# Altium project pinger-uP-re.PrjPcb
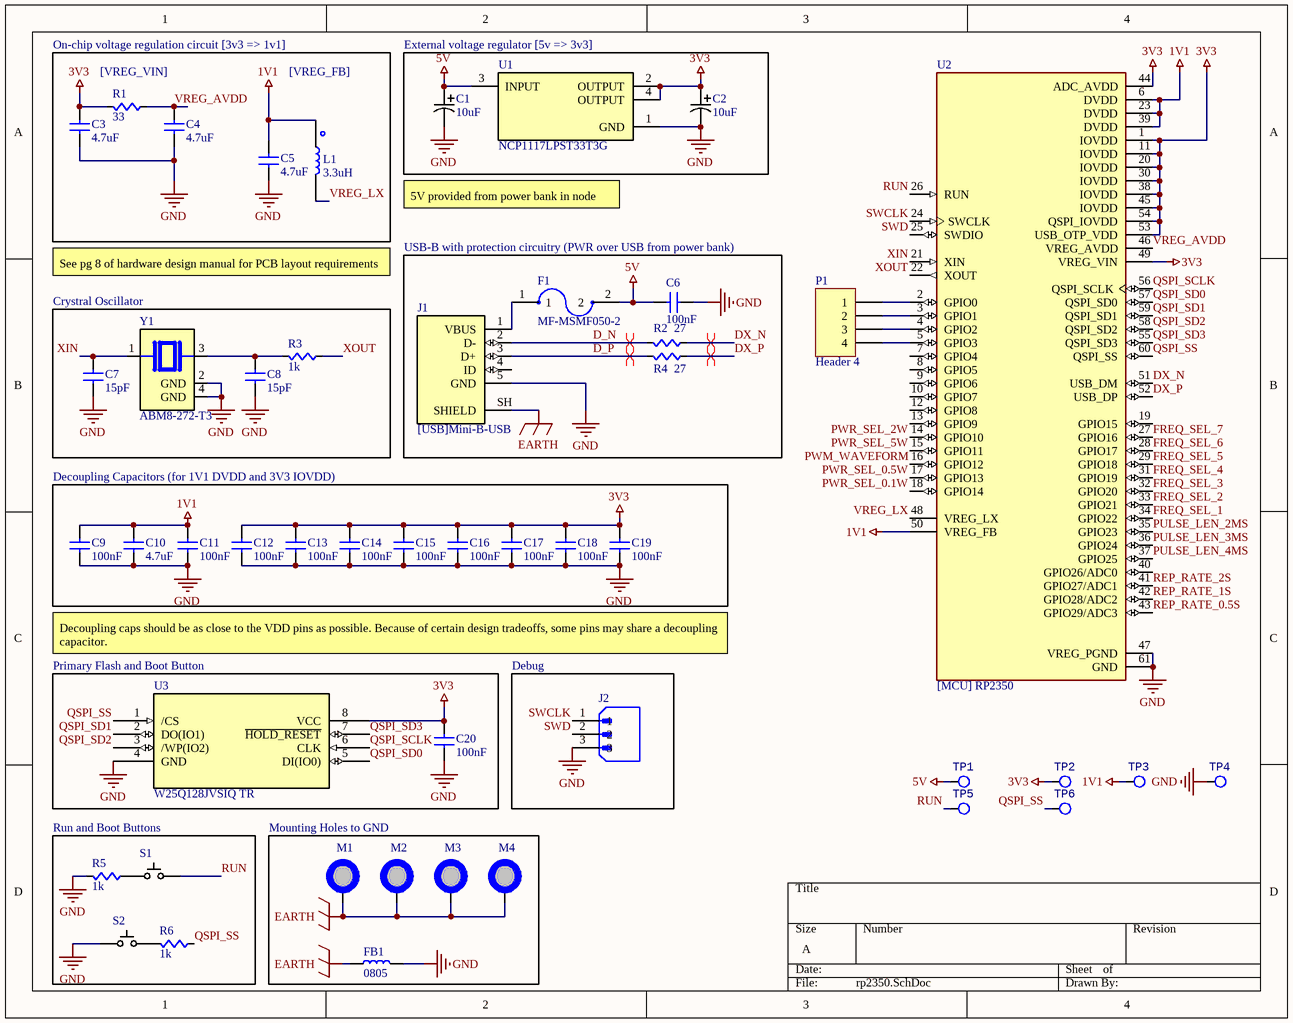
[diagram p0: rp2350.SchDoc]
2 sheets, 89 parts. Net scope: global (net labels, ports and power ports of the same name join across sheets).
Board files: joemain.PcbDoc, main.PcbDoc
Sheets:
  rp2350.SchDoc
  waveform-output.SchDoc

## Sheet rp2350.SchDoc
size A; SheetNumber: 1; SheetTotal: 2

### Parts
C1  10uF  [RADIAL_CAN_CAP_4_X_5.8_SMD]
C2  10uF  [RADIAL_CAN_CAP_4_X_5.8_SMD]
C3  value 4.7uF  [CAPC0603]  (hidden comment: Cap)
C4  value 4.7uF  [CAPC0603]  (hidden comment: Cap)
C5  value 4.7uF  [CAPC0603]  (hidden comment: Cap)
C6  value 100nF  [CAPC0603]  (hidden comment: Cap)
C7  value 15pF  [CAPC0603]  (hidden comment: Cap)
C8  value 15pF  [CAPC0603]  (hidden comment: Cap)
C9  value 100nF  [CAPC0603]  (hidden comment: Cap)
C10  value 4.7uF  [CAPC0603]  (hidden comment: Cap)
C11  value 100nF  [CAPC0603]  (hidden comment: Cap)
C12  value 100nF  [CAPC0603]  (hidden comment: Cap)
C13  value 100nF  [CAPC0603]  (hidden comment: Cap)
C14  value 100nF  [CAPC0603]  (hidden comment: Cap)
C15  value 100nF  [CAPC0603]  (hidden comment: Cap)
C16  value 100nF  [CAPC0603]  (hidden comment: Cap)
C17  value 100nF  [CAPC0603]  (hidden comment: Cap)
C18  value 100nF  [CAPC0603]  (hidden comment: Cap)
C19  value 100nF  [CAPC0603]  (hidden comment: Cap)
C20  value 100nF  [CAPC0603]  (hidden comment: Cap)
F1  MF-MSMF050-2  [FUSM4632X85]
FB1  0805  [L0805]
J1  [USB]Mini-B-USB  [SAMTEC_MUSB-05-X-B-SM-A-R-K-TR]
J2  [Connector] 1x3-header-2.54mm pitch  [1x3-2.54MM-MALE-HEADER]  (value not drawn)
L1  3.3uH  [2016_SMD_Inductor]
M1  M3 Mount Hole  [3.5MM-MOUNTING-HOLE]  (value not drawn)  (no BOM)
M2  M3 Mount Hole  [3.5MM-MOUNTING-HOLE]  (value not drawn)  (no BOM)
M3  M3 Mount Hole  [3.5MM-MOUNTING-HOLE]  (value not drawn)  (no BOM)
M4  M3 Mount Hole  [3.5MM-MOUNTING-HOLE]  (value not drawn)  (no BOM)
P1  Header 4  [HDR1X4]
R1  value 33  [RES0603]  (hidden comment: Res)
R2  value 27  [RES0603]  (hidden comment: Res)
R3  value 1k  [RES0603]  (hidden comment: Res)
R4  value 27  [RES0603]  (hidden comment: Res)
R5  value 1k  [RES0603]  (hidden comment: Res)
R6  value 1k  [RES0603]  (hidden comment: Res)
S1  [SPST] SMD Pushbutton  [[SPST] SMD Pushbutton]  (value not drawn)
S2  [SPST] SMD Pushbutton  [[SPST] SMD Pushbutton]  (value not drawn)
TP1  TP  [TPTH-100mil]  (value not drawn)  (no BOM)
TP2  TP  [TPTH-100mil]  (value not drawn)  (no BOM)
TP3  TP  [TPTH-100mil]  (value not drawn)  (no BOM)
TP4  TP  [TPTH-100mil]  (value not drawn)  (no BOM)
TP5  TP  [TPTH-100mil]  (value not drawn)  (no BOM)
TP6  TP  [TPTH-100mil]  (value not drawn)  (no BOM)
U1  NCP1117LPST33T3G  [SOT230P700X175-4N]
U2  [MCU] RP2350  [QFN40P700X700X90-61N]
U3  W25Q128JVSIQ TR  [SOIC-8-W-208MIL-2]
Y1  ABM8-272-T3  [XTAL_ABM8-272-T3]

### Blocks framed on the sheet
External voltage regulator [5v => 3v3]: C1 C2 U1
Crystral Oscillator: C7 C8 R3 Y1
Decoupling Capacitors (for 1V1 DVDD and 3V3 IOVDD): C9-C19
Primary Flash and Boot Button: C20 U3
Debug: J2
Run and Boot Buttons: R5 R6 S1 S2
Mounting Holes to GND: FB1 M1-M4

### Nets
1V1: C5.1(A) C9.1(A) C10.1(A) C11.1(A) L1.1 TP3.1 U2.6(DVDD) U2.23(DVDD) U2.39(DVDD) U2.50(VREG_FB)
3V3: C2.1 C3.1(A) C12.1(A) C13.1(A) C14.1(A) C15.1(A) C16.1(A) C17.1(A) C18.1(A) C19.1(A) C20.1(A) R1.1(A) TP2.1 U1.2(OUTPUT) U1.4(OUTPUT) U2.1(IOVDD) U2.11(IOVDD) U2.20(IOVDD) U2.30(IOVDD) U2.38(IOVDD) U2.44(ADC_AVDD) U2.45(IOVDD) U2.49(VREG_VIN) U2.53(USB_OTP_VDD) U2.54(QSPI_IOVDD) U3.8(VCC)
5V: C1.1 C6.2(B) F1.2 TP1.1 U1.3(INPUT)
EARTH: FB1.1 J1.SH(SHIELD) M1.1 M2.1 M3.1 M4.1
GND: C1.2 C2.2 C3.2(B) C4.2(B) C5.2(B) C6.1(A) C7.2(B) C8.2(B) C9.2(B) C10.2(B) C11.2(B) C12.2(B) C13.2(B) C14.2(B) C15.2(B) C16.2(B) C17.2(B) C18.2(B) C19.2(B) C20.2(B) FB1.2 J1.5(GND) J2.3 R5.1(A) S2.1 TP4.1 U1.1(GND) U2.47(VREG_PGND) U2.61(GND) U3.4(GND) Y1.2(GND) Y1.4(GND)
D_N: J1.2(D-) R2.1(A)
D_P: J1.3(D+) R4.1(A)
DX_N: R2.2(B) U2.51(USB_DM)
DX_P: R4.2(B) U2.52(USB_DP)
FREQ_SEL_1: U2.34(GPIO22)
FREQ_SEL_2: U2.33(GPIO21)
FREQ_SEL_3: U2.32(GPIO20)
FREQ_SEL_4: U2.31(GPIO19)
FREQ_SEL_5: U2.29(GPIO18)
FREQ_SEL_6: U2.28(GPIO17)
FREQ_SEL_7: U2.27(GPIO16)
PULSE_LEN_2MS: U2.35(GPIO23)
PULSE_LEN_3MS: U2.36(GPIO24)
PULSE_LEN_4MS: U2.37(GPIO25)
PWM_WAVEFORM: U2.16(GPIO12)
PWR_SEL_0.1W: U2.18(GPIO14)
PWR_SEL_0.5W: U2.17(GPIO13)
PWR_SEL_2W: U2.14(GPIO10)
PWR_SEL_5W: U2.15(GPIO11)
QSPI_SCLK: U2.56(QSPI_SCLK) U3.6(CLK)
QSPI_SD0: U2.57(QSPI_SD0) U3.5(DI(IO0))
QSPI_SD1: U2.59(QSPI_SD1) U3.2(DO(IO1))
QSPI_SD2: U2.58(QSPI_SD2) U3.3(/WP(IO2))
QSPI_SD3: U2.55(QSPI_SD3) U3.7(~{HOLD_RESET})
QSPI_SS: R6.2(B) TP6.1 U2.60(QSPI_SS) U3.1(/CS)
REP_RATE_0.5S: U2.43(GPIO29/ADC3)
REP_RATE_1S: U2.42(GPIO28/ADC2)
REP_RATE_2S: U2.41(GPIO27/ADC1)
RUN: S1.2 TP5.1 U2.26(RUN)
SWCLK: J2.1 U2.24(SWCLK)
SWD: J2.2 U2.25(SWDIO)
VREG_AVDD: C4.1(A) R1.2(B) U2.46(VREG_AVDD)
VREG_LX: L1.2 U2.48(VREG_LX)
XIN: C7.1(A) U2.21(XIN) Y1.1
XOUT: R3.2(B) U2.22(XOUT)
NetC8_1: C8.1(A) R3.1(A) Y1.3
NetF1_1: F1.1 J1.1(VBUS)
NetP1_1: P1.1 U2.2(GPIO0)
NetP1_2: P1.2 U2.3(GPIO1)
NetP1_3: P1.3 U2.4(GPIO2)
NetP1_4: P1.4 U2.5(GPIO3)
NetR5_2: R5.2(B) S1.1
NetR6_1: R6.1(A) S2.2

Not connected (* = marked no-connect by the designer): J1 4(ID); U2 7(GPIO4) 8(GPIO5) 9(GPIO6) 10(GPIO7) 12(GPIO8) 13(GPIO9) 19(GPIO15) 40(GPIO26/ADC0)

### Layout directives
differential pair: D_N, D_P, DX_N, DX_P

### Notes on the sheet
- On-chip voltage regulation circuit [3v3 => 1v1]
- [VREG_VIN]
- [VREG_FB]
- 5V provided from power bank in node
- See pg 8 of hardware design manual for PCB layout requirements
- USB-B with protection circuitry (PWR over USB from power bank)
- Decoupling caps should be as close to the VDD pins as possible. Because of certain design tradeoffs, some pins may share a decoupling capacitor.

### Library data of the parts
C1 C2 = EEE-FK1E100R: 10uF electrolytic cap, radial can, SMD; Manufacturer_Name: Panasonic; Copyright: Copyright (C) 2025 Ultra Librarian. All rights reserved.; Manufacturer_Part_Number: EEE-FK1E100R
F1 = MF-MSMF050-2: [Fuse] Polymeric PTC Resettable Fuse 15V 500 mA Ih Surface Mount 1812 (4532 Metric), Concave; MF: Bourns; MP: MF-MSMF050-2; Availability: In Stock; Check_prices: https://www.snapeda.com/parts/MF-MSMF050-2/Bourns+-+J.W.+Miller/view-part/?ref=eda; Price: None; Package: 1812 Bourns; Purchase-URL: https://pricing.snapeda.com/search/part/MF-MSMF050-2/?ref=eda; Value: *; SnapEDA_Link: https://www.snapeda.com/parts/MF-MSMF050-2/Bourns+-+J.W.+Miller/view-part/?ref=snap
FB1 = MH2029-300Y: [Inductor] Ferrite Bead Bourns MH2029-300Y / SMD-FERRITE-BEAD-30R-3A(0805); SnapEDA_Link: https://www.snapeda.com/parts/MH2029-300Y/Bourns/view-part/?ref=snap; Package: 0805 Bourns; Value: *; MF: Bourns; MP: MH2029-300Y; Check_prices: https://www.snapeda.com/parts/MH2029-300Y/Bourns/view-part/?ref=eda
J1 = [USB]Mini-B-USB: USB - mini B USB 2.0 Receptacle Connector 5 Position Surface Mount, Right Angle / MUSB-05-X-B-SM-A-R-K-TR; MF: Samtec; MP: MUSB-05-F-B-SM-A-R-K-TR; SnapEDA_Link: https://www.snapeda.com/parts/MUSB-05-F-B-SM-A-R-K-TR/Samtec/view-part/?ref=snap; Package: None; Value: *; Check_prices: https://www.snapeda.com/parts/MUSB-05-F-B-SM-A-R-K-TR/Samtec/view-part/?ref=eda
J2 = [Connector] 1x3-header-2.54mm pitch: 1x3 2.54mm header; MP: G800W305018EU; MF: FCI Connectors; Availability: In Stock; Value: *; SnapEDA_Link: https://www.snapeda.com/parts/G800W305018EU/NEC/view-part/?ref=snap; Price: None; Check_prices: https://www.snapeda.com/parts/G800W305018EU/NEC/view-part/?ref=eda; Package: None
L1 = INDUCTOR 3.3uH: Power Inductors - SMD IND 3.3uH used for RP2350 VREG; Manufacturer_Name: ABRACON; Manufacturer_Part_Number: AOTA-B201610S3R3-101-T; Geometry.Height: 1mm; Mouser Part Number: 815-AB201610S3R3101T; Mouser Price/Stock: https://www.mouser.co.uk/ProductDetail/ABRACON/AOTA-B201610S3R3-101-T?qs=%252BXxaIXUDbq0IZvJW%2F2mv4w%3D%3D; Datasheet Link: https://abracon.com/datasheets/AOTA-B201610S3R3-101-T.pdf
M1-M4 = [Mount] M3 Mount Hole: Place at least 4.5mm from board edge. Plated.
P1 = Header 4: Header, 4-Pin; LatestRevisionDate: 17-Jul-2002; LatestRevisionNote: Re-released for DXP Platform.; Publisher: Altium Limited
R1-R6 = Res: SMD, RES0603; Supplier 1: Digi-Key; Supplier Part Number 1: RMCF0603JT10K0CT-ND
S1 S2 = [SPST] SMD Pushbutton: PTS815SJM250SMTRLFS; Supplier 1: DigiKey; Supplier Part Number 1: CKN12215-6-ND
TP1-TP6 = TP: Test Point
U1 = NCP1117LPST33T3G: Linear Voltage Regulator IC Positive Fixed 1 Output 1A SOT-223; MF: ON Semiconductor; SnapEDA_Link: https://www.snapeda.com/parts/NCP1117LPST33T3G/Onsemi/view-part/?ref=snap; Package: SOT-223-4 ON Semiconductor; Value: *; MP: NCP1117LPST33T3G; Check_prices: https://www.snapeda.com/parts/NCP1117LPST33T3G/Onsemi/view-part/?ref=eda
U2 = SC1509(13): RP2350A MCU from Raspberry Pi Pico; QFN 60 7x7,; MP: SC1509-A4; SnapEDA_Link: https://www.snapeda.com/parts/SC1509-A4/Raspberry+Pi/view-part/?ref=snap; Package: None; Value: *; MF: Raspberry Pi; Check_prices: https://www.snapeda.com/parts/SC1509-A4/Raspberry+Pi/view-part/?ref=eda
U3 = W25Q128JVSIQ TR: IC FLASH 128MBIT SPI/QUAD 8SOIC; Manufacturer_Name: Winbond; Copyright: Copyright (C) 2025 Ultra Librarian. All rights reserved.; Manufacturer_Part_Number: W25Q128JVSIQ TR; RefDes: RefDes; Type: Type
Y1 = ABM8-272-T3: 12 MHz Â±30ppm Crystal 10pF 50 Ohms 4-SMD, No Lead; MF: ABRACON; SnapEDA_Link: https://www.snapeda.com/parts/ABM8-272-T3/Abracon/view-part/?ref=snap; Package: NON-STANDARD-4 Abracon; Value: *; MP: ABM8-272-T3; Check_prices: https://www.snapeda.com/parts/ABM8-272-T3/Abracon/view-part/?ref=eda
C3-C20 = Cap: Supplier 1: Digi-Key; Supplier Part Number 1: 1276-1000-1-ND

## Sheet waveform-output.SchDoc
size A; SheetNumber: 2; SheetTotal: 2
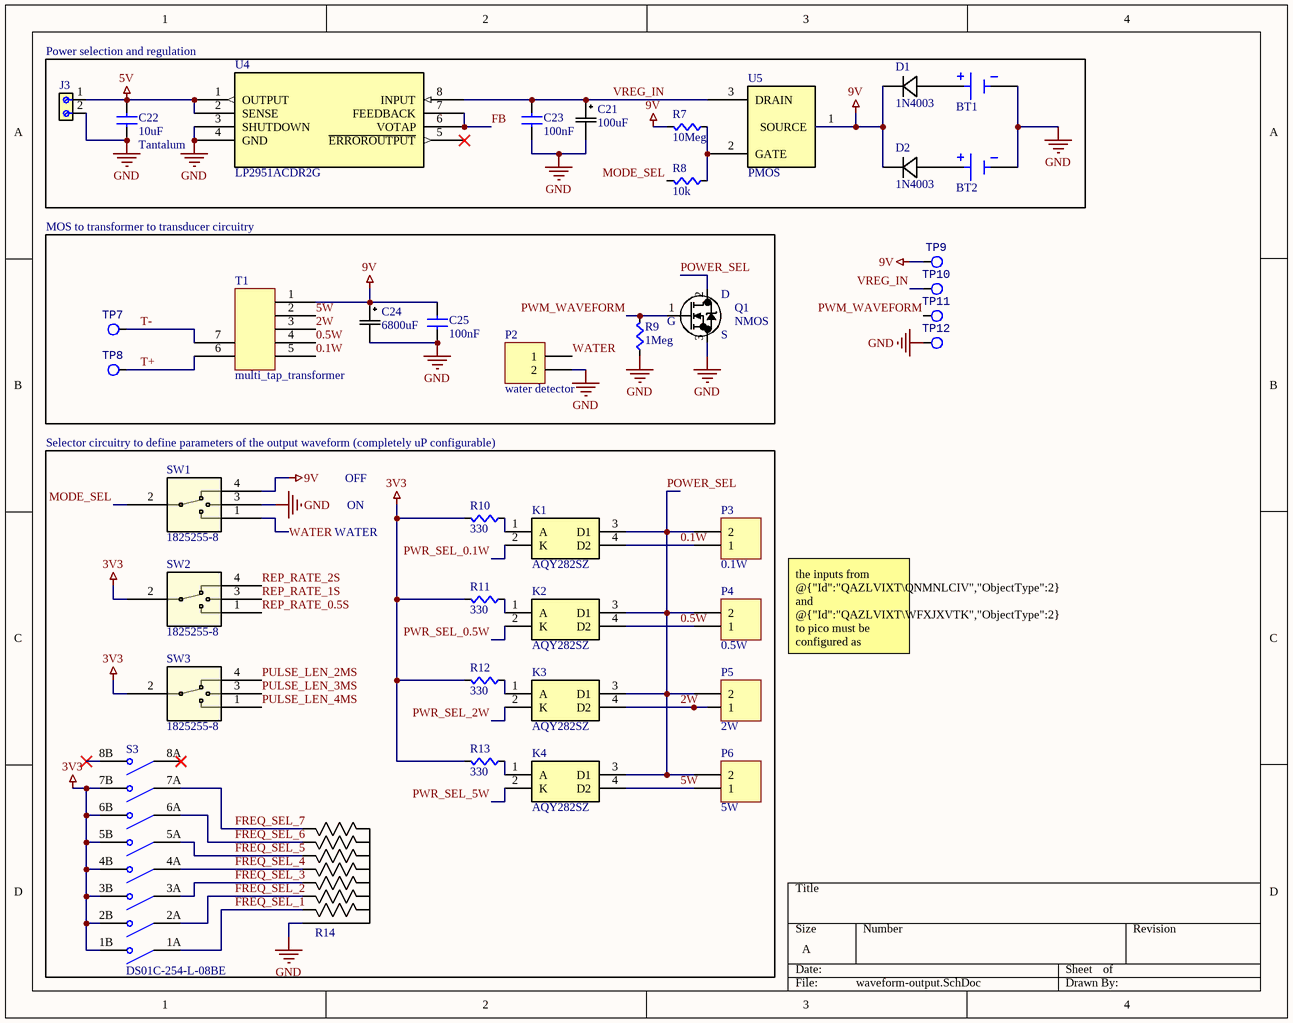
[diagram p1: waveform-output.SchDoc]

### Parts
BT1  593_594  [BAT_593]  (value not drawn)
BT2  593_594  [BAT_593]  (value not drawn)
C21  100uF  [CAP_SMT_RADIAL_W6.6MM_D6.3MM]
C22  Tantalum  value 10uF  [CAPC0603]
C23  value 100nF  [CAPC0603]  (hidden comment: Cap)
C24  6800uF  [CAP_TH_RADIAL_W18MM_D7.5MM]
C25  value 100nF  [CAPC0603]  (hidden comment: Cap)
D1  1N4003  [CR_1N4005_ONS]
D2  1N4003  [CR_1N4005_ONS]
J3  [Connector] 691213510002  [[CONNECTOR] 5MM_2PORT_SCREW]  (value not drawn)
K1  AQY282SZ  [AQY282SZ]
K2  AQY282SZ  [AQY282SZ]
K3  AQY282SZ  [AQY282SZ]
K4  AQY282SZ  [AQY282SZ]
P2  water detector  [HDR1X2]
P3  0.1W  [HDR1X2]
P4  0.5W  [HDR1X2]
P5  2W  [HDR1X2]
P6  5W  [HDR1X2]
Q1  NMOS  [TO-252AA]
R7  value 10Meg  [RES0603]  (hidden comment: Res)
R8  value 10k  [RES0603]  (hidden comment: Res)
R9  value 1Meg  [RES0603]  (hidden comment: Res)
R10  value 330  [RES0603]  (hidden comment: Res)
R11  value 330  [RES0603]  (hidden comment: Res)
R12  value 330  [RES0603]  (hidden comment: Res)
R13  value 330  [RES0603]  (hidden comment: Res)
R14  4608X-101-105LF  [BO_4608X]  (value not drawn)
S3  DS01C-254-L-08BE  [SW_DS01C-254-L-08BE]
SW1  1825255-8  [MHS-133_TEC]
SW2  1825255-8  [MHS-133_TEC]
SW3  1825255-8  [MHS-133_TEC]
T1  multi_tap_transformer  [multi_tap_transformer]
TP7  TP  [TPTH-100mil]  (value not drawn)  (no BOM)
TP8  TP  [TPTH-100mil]  (value not drawn)  (no BOM)
TP9  TP  [TPTH-100mil]  (value not drawn)  (no BOM)
TP10  TP  [TPTH-100mil]  (value not drawn)  (no BOM)
TP11  TP  [TPTH-100mil]  (value not drawn)  (no BOM)
TP12  TP  [TPTH-100mil]  (value not drawn)  (no BOM)
U4  LP2951ACDR2G  [SOIC8-3.9MM]
U5  PMOS  [TO-92]

### Blocks framed on the sheet
Power selection and regulation: BT1 BT2 C21-C23 D1 D2 J3 R7 R8 U4 U5
MOS to transformer to transducer circuitry: C24 C25 P2 Q1 R9 T1 TP7 TP8

### Nets
3V3: R10.2(B) R11.2(B) R12.2(B) R13.2(B) S3.1B(NO1) S3.2B(NO2) S3.3B(NO3) S3.4B(NO4) S3.5B(NO5) S3.6B(NO6) S3.7B(NO7) SW2.2 SW3.2
5V: C22.2(B) J3.1 U4.1(OUTPUT) U4.2(SENSE)
9V: C24.1 C25.1(A) D1.1 D2.1 R7.2(B) SW1.4 T1.1 TP9.1 U5.1(SOURCE)
GND: BT1.2(NEG) BT2.2(NEG) C21.2 C22.1(A) C23.2(B) C24.2 C25.2(B) J3.2 P2.2 Q1.3(S) R9.2(B) R14.1 SW1.3 TP12.1 U4.3(SHUTDOWN) U4.4(GND)
0.1W: K1.4(D2) P3.1 T1.5
0.5W: K2.4(D2) P4.1 T1.4
2W: K3.4(D2) P5.1 T1.3
5W: K4.4(D2) P6.1 T1.2
FB: U4.6(VOTAP) U4.7(FEEDBACK)
FREQ_SEL_1: R14.2 S3.1A(COM1)
FREQ_SEL_2: R14.3 S3.2A(COM2)
FREQ_SEL_3: R14.4 S3.3A(COM3)
FREQ_SEL_4: R14.5 S3.4A(COM4)
FREQ_SEL_5: R14.6 S3.5A(COM5)
FREQ_SEL_6: R14.7 S3.6A(COM6)
FREQ_SEL_7: R14.8 S3.7A(COM7)
MODE_SEL: R8.2(B) SW1.2
POWER_SEL: K1.3(D1) K2.3(D1) K3.3(D1) K4.3(D1) P3.2 P4.2 P5.2 P6.2 Q1.2(D)
PULSE_LEN_2MS: SW3.4
PULSE_LEN_3MS: SW3.3
PULSE_LEN_4MS: SW3.1
PWM_WAVEFORM: Q1.1(G) R9.1(A) TP11.1
PWR_SEL_0.1W: K1.2(K)
PWR_SEL_0.5W: K2.2(K)
PWR_SEL_2W: K3.2(K)
PWR_SEL_5W: K4.2(K)
REP_RATE_0.5S: SW2.1
REP_RATE_1S: SW2.3
REP_RATE_2S: SW2.4
T+: T1.6 TP8.1
T-: T1.7 TP7.1
VREG_IN: C21.1 C23.1(A) TP10.1 U4.8(INPUT) U5.3(DRAIN)
WATER: P2.1 SW1.1
NetBT1_1: BT1.1(NEG) D1.2
NetBT2_1: BT2.1(NEG) D2.2
NetK1_1: K1.1(A) R10.1(A)
NetK2_1: K2.1(A) R11.1(A)
NetK3_1: K3.1(A) R12.1(A)
NetK4_1: K4.1(A) R13.1(A)
NetR7_1: R7.1(A) R8.1(A) U5.2(GATE)

Not connected (* = marked no-connect by the designer): S3 8A(COM8)* 8B(NO8)*; U4 5(~{ERROROUTPUT})*

### Notes on the sheet
- (near SW1) Selector circuitry to define parameters of the output waveform (completely uP configurable)
- OFF
- ON
- WATER
- the inputs from @{"Id":"QAZLVIXT\QNMNLCIV","ObjectType":2} and @{"Id":"QAZLVIXT\WFXJXVTK","ObjectType":2} to pico must be configured as pulldown resistors in firmware

### Library data of the parts
BT1 BT2 = 593_594: Battery Contact Snap (Negative) 9V Cell PC Pin; MF: Keystone Electronics; MP: 593; Package: None; Price: None; Value: *; Availability: Unavailable
C21 = EXV107M025A9HAA: 100 µF 25 V Aluminum Electrolytic Capacitors Radial, Can - SMD 340mOhm @ 100kHz 3000 Hrs @ 105°C; Manufacturer_Name: Kemet; Copyright: Copyright (C) 2026 Ultra Librarian. All rights reserved.; Manufacturer_Part_Number: EXV107M025A9HAA
C22 = Cap: Supplier 1: Digi-Key; Supplier Part Number 1: 1276-1000-1-ND
C24 = UKL1A682KHD: 6800 µF 10 V Aluminum Electrolytic Capacitors Radial, Can 2000 Hrs @ 85°C; Manufacturer_Name: Nichicon; Copyright: Copyright (C) 2026 Ultra Librarian. All rights reserved.; Manufacturer_Part_Number: UKL1A682KHD; Digi-Key_Part_Number_1: UKL1A682KHD-ND
D1 D2 = 1N4003: Diode 200 V 1A Through Hole DO-41; Manufacturer_Name: onsemi; Copyright: Copyright (C) 2025 Ultra Librarian. All rights reserved.; Manufacturer_Part_Number: 1N4003
J3 = [Connector] 691213510002: 2 Position Wire to Board Terminal Block Horizontal with Board 0.200 (5.08mm) Through Hole; MF: WÃ¼rth Elektronik; SnapEDA_Link: https://www.snapeda.com/parts/691213510002/W%25C3%25BCrth+Elektronik+Midcom/view-part/?ref=snap; Package: None; Value: *; MP: 691213510002; Check_prices: https://www.snapeda.com/parts/691213510002/W%25C3%25BCrth+Elektronik+Midcom/view-part/?ref=eda
K1-K4 = AQY282SZ: Solid State Relays - PCB Mount 60v 500mA SOP Form A Norm-Open; Manufacturer_Name: Panasonic; Geometry.Height: 2.3mm; Mouser Part Number: 769-AQY282SZ; Mouser Price/Stock: https://www.mouser.co.uk/ProductDetail/Panasonic-Industrial-Devices/AQY282SZ?qs=2rFUEsTwVNwY5EkJsHQb1w%3D%3D; Manufacturer_Part_Number: AQY282SZ; Datasheet Link: https://media.digikey.com/pdf/Data%20Sheets/Panasonic%20Electric%20Works%20PDFs/AQY28_S_Spec.pdf
P2-P6 = Header 2: Header, 2-Pin; LatestRevisionDate: 17-Jul-2002; LatestRevisionNote: Re-released for DXP Platform.; Publisher: Altium Limited
Q1 = RFD14N05LSM: N-Channel 50 V 14A (Tc) 48W (Tc) Surface Mount TO-252AA; Manufacturer_Name: onsemi; Copyright: Copyright (C) 2025 Ultra Librarian. All rights reserved.; Manufacturer_Part_Number: RFD14N05LSM
R7-R13 = Res: SMD, RES0603; Supplier 1: Digi-Key; Supplier Part Number 1: RMCF0603JT10K0CT-ND
R14 = 4608X-101-105LF: 1M Ohm ±2% 200mW Power Per Element Bussed 7 Resistor Network/Array ±100ppm/°C 8-SIP; Manufacturer_Name: Bourns Electronics; Copyright: Copyright (C) 2026 Ultra Librarian. All rights reserved.; Manufacturer_Part_Number: 4608X-101-105LF
S3 = DS01C-254-L-08BE: 8 Position, Through Hole, 2.54 mm Pitch, Raised Slide Actuator, Convex Bottom, Long Pin, DIP Switch; MF: Same Sky; SnapEDA_Link: https://www.snapeda.com/parts/DS01C-254-L-08BE/Same+Sky/view-part/?ref=snap; Package: None; Value: *; MP: DS01C-254-L-08BE; Check_prices: https://www.snapeda.com/parts/DS01C-254-L-08BE/Same+Sky/view-part/?ref=eda
SW1-SW3 = 1825255-8: MHS133G04=SP3T SL SW VERT AU; Manufacturer_Name: TE Connectivity; Type: Slide Switches; Copyright: Copyright (C) 2025 Ultra Librarian. All rights reserved.; Manufacturer_Part_Number: 1825255-8; RefDes: RefDes
TP7-TP12 = TP: Test Point
U4 = LP2951ACDR2G: Linear Voltage Regulator IC Positive Adjustable (Fixed) 1 Output 100mA 8-SOIC; Manufacturer_Name: onsemi; Copyright: Copyright (C) 2026 Ultra Librarian. All rights reserved.; Manufacturer_Part_Number: LP2951ACDR2G; RefDes: RefDes; Type: Type
U5 = VP0808L-G: P-Channel 80 V 280mA (Tj) 1W (Tc) Through Hole TO-92-3; Manufacturer_Name: Microchip; Copyright: Copyright (C) 2026 Ultra Librarian. All rights reserved.; Manufacturer_Part_Number: VP0808L-G; RefDes: RefDes; Type: Type
C23 C25 = Cap: Supplier 1: Digi-Key; Supplier Part Number 1: 1276-1000-1-ND

## Nets that join several sheets
3V3: rp2350 (26 pins), waveform-output (13 pins)
5V: rp2350 (5 pins), waveform-output (C22.2 J3.1 U4.1 U4.2)
GND: rp2350 (32 pins), waveform-output (16 pins)
FREQ_SEL_1: rp2350 (U2.34), waveform-output (R14.2 S3.1A)
FREQ_SEL_2: rp2350 (U2.33), waveform-output (R14.3 S3.2A)
FREQ_SEL_3: rp2350 (U2.32), waveform-output (R14.4 S3.3A)
FREQ_SEL_4: rp2350 (U2.31), waveform-output (R14.5 S3.4A)
FREQ_SEL_5: rp2350 (U2.29), waveform-output (R14.6 S3.5A)
FREQ_SEL_6: rp2350 (U2.28), waveform-output (R14.7 S3.6A)
FREQ_SEL_7: rp2350 (U2.27), waveform-output (R14.8 S3.7A)
PULSE_LEN_2MS: rp2350 (U2.35), waveform-output (SW3.4)
PULSE_LEN_3MS: rp2350 (U2.36), waveform-output (SW3.3)
PULSE_LEN_4MS: rp2350 (U2.37), waveform-output (SW3.1)
PWM_WAVEFORM: rp2350 (U2.16), waveform-output (Q1.1 R9.1 TP11.1)
PWR_SEL_0.1W: rp2350 (U2.18), waveform-output (K1.2)
PWR_SEL_0.5W: rp2350 (U2.17), waveform-output (K2.2)
PWR_SEL_2W: rp2350 (U2.14), waveform-output (K3.2)
PWR_SEL_5W: rp2350 (U2.15), waveform-output (K4.2)
REP_RATE_0.5S: rp2350 (U2.43), waveform-output (SW2.1)
REP_RATE_1S: rp2350 (U2.42), waveform-output (SW2.3)
REP_RATE_2S: rp2350 (U2.41), waveform-output (SW2.4)